# Altium project 机器人大赛硬件.PrjPcb (part 2 of 3)
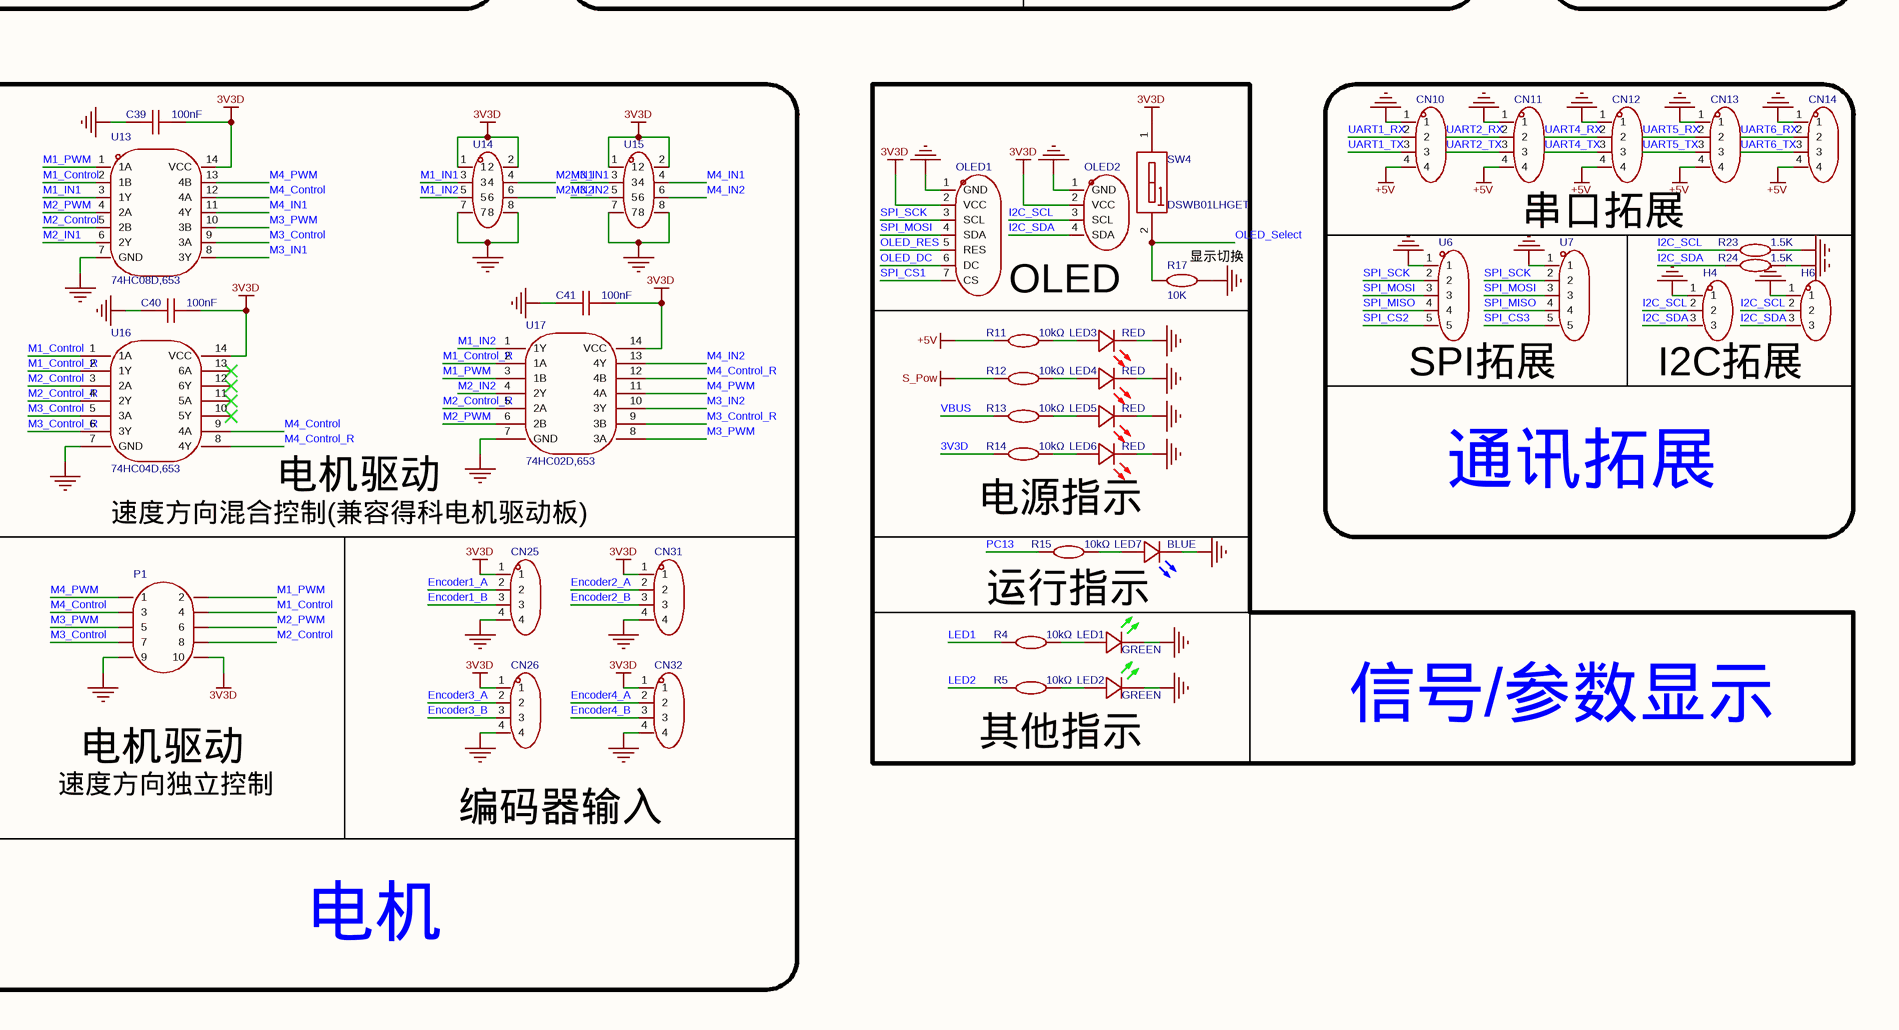
[diagram p4: P1.schdoc, bottom right]

## Sheet P1.schdoc (continued)
### Library data of the parts
C1-C21 C24-C28 C30 C31 C33-C38 = CAP_0603: Symbol: Capacitance; ConvertToPcb: yes; ModelId: ac125912035d415993ca9572d50418b1聨0819f05c4eef4c71ace90d822a990e87; ModelName: C0603_L1.6-W0.8-H0.8; ModelTransform: 62.992,31.496,0,0,0,0,0,0,0; Device: CAP_0603; AddInBom: yes; Supplier Footprint: 0603; FootprintName: C0603
  C1 C2: Value: 20pF
  C3 C4: Value: 2.2uF
  C5 C6: Value: 12.5pF
  C7 C20 C24 C35 C36: Value: 10uF
  C8-C19 C25 C28 C33 C34 C38: Value: 100nF
  C21: Value: 1uF
  C26 C27 C37: Value: 22uF
  C30: Value: 100pF
  C31: Value: 4.7nF
C22 = MA10V470M6X8: 容值:470uF;精度:±20%;额定电压:10V;纹波电流:3.1A@100kHz;等效串联电阻(ESR):20mΩ@100kHz;类型:聚合物;; Manufacturer: JIERR(捷而瑞); AddInBom: yes; ModelId: ccbda52dceed4b139172c40f75c9da3f聨0819f05c4eef4c71ace90d822a990e87; ModelTransform: 287.401,259.842,0,0,0,0,0,0,0; Tolerance: ±20%; Voltage Rating: 10V; Type: 聚合物; Lifetime: 2000hrs@105℃; Symbol: MA10V470M6X8; Device: MA10V470M6X8; LCSC Part Name: 470uF ±20% 10V; SupplierPart: C46550459; ManufacturerPart: MA10V470M6X8; Supplier Footprint: SMD,D6.3xL7.7mm; JLCPCB Part Class: Extended Part; Datasheet: https://item.szlcsc.com/datasheet/MA10V470M6X8/48680153.html; Supplier: LCSC; ConvertToPcb: yes; FootprintName: CAP-SMD_BD6.3-L6.6-W6.6-LS7.3-FD-H7.7; ModelName: CAP-SMD_BD6.3-L6.6-W6.6-LS7.3-FD-H7.7; Value: 470uF; Ripple Current: 3.1A@100kHz; Equivalent Series Resistance(ESR): 20mΩ@100kHz; Diameter: 6.3mm; Height - Seated (Max): 7mm; Operating Temperature: -55℃~+105℃
C23 C39-C41 = CAP_0603: Symbol: Capacitance; 3D Model: ac125912035d415993ca9572d50418b1聨0819f05c4eef4c71ace90d822a990e87; 3D Model Transform: 62.992,31.496,0,0,0,0,0,0,0; ConvertToPcb: yes; ModelName: C0603_L1.6-W0.8-H0.8; Device: CAP_0603; Supplier Footprint: 0603; AddInBom: yes; FootprintName: C0603
  C23: Value: 22uF
  C39-C41: Value: 100nF
C29 C32 = CGA0805X5R476M100MT: 容值:47uF;精度:±20%;额定电压:10V;温度系数:X5R;; Manufacturer: HRE(芯声); AddInBom: yes; ModelId: 1ba041120af144c991958decab20d241聨0819f05c4eef4c71ace90d822a990e87; ModelName: C0805_L2.0-W1.3-H1.3; ModelTransform: 78.74,51.181,0,0,0,0,0,0.0005,0; Tolerance: ±20%; Voltage Rating: 10V; Temperature Coefficient: X5R; Symbol: CGA0805X5R476M100MT; Device: CGA0805X5R476M100MT; LCSC Part Name: 47uF ±20% 10V; SupplierPart: C6119904; ManufacturerPart: CGA0805X5R476M100MT; Supplier Footprint: 0805; JLCPCB Part Class: Extended Part; Datasheet: https://item.szlcsc.com/datasheet/CGA0805X5R476M100MT/7062610.html; Supplier: LCSC; ConvertToPcb: yes; FootprintName: C0805; Value: 47uF
CN1-CN8 = ZX-XH2.54-3PZZ: 插针结构:1x3P;间距:2.5mm;安装方式:直插;参考系列:XH;总PIN数:3P;排数:1;每排PIN数:3;行距:-;额定电流:3A;触头材质:黄铜;触头镀层:锡;工作温度:-25℃~+85℃;; Manufacturer: Megastar(兆星); AddInBom: yes; ModelId: 59fb7dae5f784ea68cfa01be7f96d370聨0819f05c4eef4c71ace90d822a990e87; ModelTransform: 393.7,224.409,0,0,0,0,0,15.748,-137.795; Pins Structure: 1x3P; Pitch: 2.5mm; Reference Series: XH; Number of PINs Per Row: 3; Current Rating: 3A; Voltage Rating: 250V; Plastic Material: PA66; Flame Retardant Rating: UL94V-0; Z-Height of the Board: 7mm; X-Length of Bottom Edge on Board (Spacing Line): 10mm; Y-Width of Bottom Edge on Board: 5.9mm; Symbol: ZX-XH2.54-3PZZ; Device: ZX-XH2.54-3PZZ; LCSC Part Name: 1x3P 间距:2.5mm 直插 系列:XH; SupplierPart: C7429633; ManufacturerPart: ZX-XH2.54-3PZZ; Supplier Footprint: 插件,P=2.5mm; JLCPCB Part Class: Extended Part; Datasheet: https://item.szlcsc.com/datasheet/ZX-XH2.54-3PZZ/8427550.html; Supplier: LCSC; ConvertToPcb: yes; FootprintName: CONN-TH_3P-P2.54_2501S-3P; ModelName: CONN-TH_3P-P2.54_2501S-3P; Mounting Type: 直插; Number of Pins: 3P; Number of Rows: 1; Row Spacing: -; Contact Material: 黄铜; Contact Plating: 锡; Operating Temperature: -25℃~+85℃; Supplementary Features: -; Color: 白色
CN9 = XT60PW-M: 模型锂电连接器; Manufacturer: AMASS(艾迈斯); AddInBom: yes; ModelId: 37912d55e50045169535334d164bae93聨0819f05c4eef4c71ace90d822a990e87; ModelTransform: 712.597,610.235,0,0,0,0,-161.417,0,-118.11; Connector type: 卧式插头; interface form: 公头; Symbol: XT60PW-M; Device: XT60PW-M; LCSC Part Name: AMASS(艾迈斯)航模插头xt60连接器150公母对接pw锂电池公头 接PCB板卧式 黄色 公头XT60PW-M.G.Y; SupplierPart: C98732; ManufacturerPart: XT60PW-M; Supplier Footprint: -; JLCPCB Part Class: Extended Part; Datasheet: https://item.szlcsc.com/datasheet/XT60PW-M/99942.html; Supplier: LCSC; ConvertToPcb: yes; FootprintName: CONN-TH_XT60PW-M; ModelName: CONN-TH_XT60PW-M; colour: 黄色
CN10 = ZX-XH2.54-4PZZ: 插针结构:1x4P;间距:2.5mm;安装方式:直插;参考系列:XH;总PIN数:4P;排数:1;每排PIN数:4;行距:-;额定电流:3A;触头材质:黄铜;触头镀层:锡;工作温度:-25℃~+85℃;; Manufacturer: Megastar(兆星); AddInBom: yes; ModelId: 5458b55d28744a3c82c1e0e5bffe4e87聨0819f05c4eef4c71ace90d822a990e87; ModelTransform: 492.125,224.409,0,180,0,0,0,17.717,-118.11; Pins Structure: 1x4P; Pitch: 2.5mm; Reference Series: XH; Number of PINs Per Row: 4; Current Rating: 3A; Voltage Rating: 250V; Plastic Material: PA66; Flame Retardant Rating: UL94V-0; Z-Height of the Board: 7mm; X-Length of Bottom Edge on Board (Spacing Line): 12.5mm; Y-Width of Bottom Edge on Board: 5.9mm; Symbol: ZX-XH2.54-4PZZ; Device: ZX-XH2.54-4PZZ; LCSC Part Name: 1x4P 间距:2.5mm 直插 系列:XH; SupplierPart: C7429634; ManufacturerPart: ZX-XH2.54-4PZZ; Supplier Footprint: 插件,P=2.5mm; JLCPCB Part Class: Extended Part; Datasheet: https://item.szlcsc.com/datasheet/ZX-XH2.54-4PZZ/8427551.html; Supplier: LCSC; ConvertToPcb: yes; FootprintName: CONN-TH_4P-P2.50_4PIN; ModelName: CONN-TH_4P-P2.50_4PIN; Mounting Type: 直插; Number of Pins: 4P; Number of Rows: 1; Row Spacing: -; Contact Material: 黄铜; Contact Plating: 锡; Operating Temperature: -25℃~+85℃; Supplementary Features: -; Color: 白色
CN11-CN14 = ZX-XH2.54-4PZZ: 插针结构:1x4P;间距:2.5mm;安装方式:直插;参考系列:XH;总PIN数:4P;排数:1;每排PIN数:4;行距:-;额定电流:3A;触头材质:黄铜;触头镀层:锡;工作温度:-25℃~+85℃;; Manufacturer: Megastar(兆星); 3D Model: 5458b55d28744a3c82c1e0e5bffe4e87聨0819f05c4eef4c71ace90d822a990e87; 3D Model Transform: 492.125,224.409,0,180,0,0,0,17.717,-118.11; Pins Structure: 1x4P; Pitch: 2.5mm; Reference Series: XH; Number of PINs Per Row: 4; Current Rating: 3A; Voltage Rating: 250V; Plastic Material: PA66; Flame Retardant Rating: UL94V-0; Z-Height of the Board: 7mm; X-Length of Bottom Edge on Board (Spacing Line): 12.5mm; Y-Width of Bottom Edge on Board: 5.9mm; AddInBom: yes; Symbol: ZX-XH2.54-4PZZ; Device: ZX-XH2.54-4PZZ; LCSC Part Name: 1x4P 间距:2.5mm 直插 系列:XH; Supplier Part: C7429634; Manufacturer Part: ZX-XH2.54-4PZZ; Supplier Footprint: 插件,P=2.5mm; JLCPCB Part Class: Extended Part; Datasheet: https://item.szlcsc.com/datasheet/ZX-XH2.54-4PZZ/8427551.html; Supplier: LCSC; Mounting Type: 直插; Number of Pins: 4P; Number of Rows: 1; Row Spacing: -; Contact Material: 黄铜; Contact Plating: 锡; Operating Temperature: -25℃~+85℃; Supplementary Features: -; Color: 白色; ConvertToPcb: yes; FootprintName: CONN-TH_4P-P2.50_4PIN; ModelName: CONN-TH_4P-P2.50_4PIN
CN15-CN22 = HX-XH2.54-3PZZ: 插针结构:1x3P;间距:2.54mm;安装方式:直插;参考系列:XH;总PIN数:3P;排数:1;每排PIN数:3;行距:-;额定电流:3A;触头材质:黄铜;触头镀层:锡;工作温度:-25℃~+85℃;; Manufacturer: hanxia(韩下); AddInBom: yes; ModelId: 7caf8641f1664f899c46ebd0270126f6聨0819f05c4eef4c71ace90d822a990e87; ModelTransform: 393.7,232.6767,0,0,0,0,0,21.654,-133.858; Pins Structure: 1x3P; Pitch: 2.54mm; Reference Series: XH; Number of PINs Per Row: 3; Current Rating: 3A; Voltage Rating: 250V; Plastic Material: PA66; Flame Retardant Rating: UL94V-0; Symbol: HX-XH2.54-3PZZ; Device: HX-XH2.54-3PZZ; LCSC Part Name: 1x3P 间距:2.54mm 直插 系列:XH; SupplierPart: C42391661; ManufacturerPart: HX-XH2.54-3PZZ; Supplier Footprint: 插件,P=2.5mm; JLCPCB Part Class: Extended Part; Datasheet: https://item.szlcsc.com/datasheet/HX-XH2.54-3PZZ/44326933.html; Supplier: LCSC; ConvertToPcb: yes; FootprintName: CONN-TH_3P-P2.50_HC-XH-3A-G; ModelName: CONN-TH_3P-P2.50_HC-XH-3A-G; Mounting Type: 直插; Number of Pins: 3P; Number of Rows: 1; Row Spacing: -; Contact Material: 黄铜; Contact Plating: 锡; Operating Temperature: -25℃~+85℃; Color: 白色
CN23 CN24 CN27-CN30 CN33 CN34 = HX-XH2.54-3PZZ: 插针结构:1x3P;间距:2.54mm;安装方式:直插;参考系列:XH;总PIN数:3P;排数:1;每排PIN数:3;行距:-;额定电流:3A;触头材质:黄铜;触头镀层:锡;工作温度:-25℃~+85℃;; Manufacturer: hanxia(韩下); 3D Model: 7caf8641f1664f899c46ebd0270126f6聨0819f05c4eef4c71ace90d822a990e87; 3D Model Transform: 393.7,232.6767,0,0,0,0,0,21.654,-133.858; Pins Structure: 1x3P; Pitch: 2.54mm; Reference Series: XH; Number of PINs Per Row: 3; Current Rating: 3A; Voltage Rating: 250V; Plastic Material: PA66; Flame Retardant Rating: UL94V-0; AddInBom: yes; Symbol: HX-XH2.54-3PZZ; Device: HX-XH2.54-3PZZ; LCSC Part Name: 1x3P 间距:2.54mm 直插 系列:XH; Supplier Part: C42391661; Manufacturer Part: HX-XH2.54-3PZZ; Supplier Footprint: 插件,P=2.5mm; JLCPCB Part Class: Extended Part; Datasheet: https://item.szlcsc.com/datasheet/HX-XH2.54-3PZZ/44326933.html; Supplier: LCSC; Mounting Type: 直插; Number of Pins: 3P; Number of Rows: 1; Row Spacing: -; Contact Material: 黄铜; Contact Plating: 锡; Operating Temperature: -25℃~+85℃; Color: 白色; ConvertToPcb: yes; FootprintName: CONN-TH_3P-P2.50_HC-XH-3A-G; ModelName: CONN-TH_3P-P2.50_HC-XH-3A-G
CN25 CN26 CN31 CN32 = HX-XH2.54-4PZZ: 插针结构:1x4P;间距:2.54mm;安装方式:直插;参考系列:XH;总PIN数:4P;排数:1;每排PIN数:4;行距:-;额定电流:3A;触头材质:黄铜;触头镀层:锡;工作温度:-25℃~+85℃;; Manufacturer: hanxia(韩下); AddInBom: yes; ModelId: c69236e4c0a047c6aeeeefc1552045f5聨0819f05c4eef4c71ace90d822a990e87; ModelTransform: 492.125,228.346,0,180,0,0,0,-19.685,-137.795; Pins Structure: 1x4P; Pitch: 2.54mm; Reference Series: XH; Number of PINs Per Row: 4; Current Rating: 3A; Voltage Rating: 250V; Plastic Material: PA66; Flame Retardant Rating: UL94V-0; Symbol: HX-XH2.54-4PZZ; Device: HX-XH2.54-4PZZ; LCSC Part Name: 1x4P 间距:2.54mm 直插 系列:XH; SupplierPart: C42391662; ManufacturerPart: HX-XH2.54-4PZZ; Supplier Footprint: 插件,P=2.5mm; JLCPCB Part Class: Extended Part; Datasheet: https://item.szlcsc.com/datasheet/HX-XH2.54-4PZZ/44326934.html; Supplier: LCSC; ConvertToPcb: yes; FootprintName: CONN-TH_4P-P2.50-XH2.54-4P; ModelName: CONN-TH_4P-P2.50-XH2.54-4P; Mounting Type: 直插; Number of Pins: 4P; Number of Rows: 1; Row Spacing: -; Contact Material: 黄铜; Contact Plating: 锡; Operating Temperature: -25℃~+85℃; Color: 白色
D1 D2 = SMBJ6.5CA_C7420377: 极性:双向;反向截止电压(Vrwm):6.5V;钳位电压:11.2V;峰值脉冲电流(Ipp):53.57A;峰值脉冲功率(Ppp):600W;击穿电压:7.22V;; Manufacturer: R+O(宏嘉诚); AddInBom: yes; ModelId: feee8e3be32446ff9c045f3dafa6b9cb聨0819f05c4eef4c71ace90d822a990e87; ModelTransform: 208.661,139.764,0,0,0,0,0,0,0; Polarity: 双向; Reverse Stand-Off Voltage (Vrwm): 6.5V; Clamping Voltage: 11.2V; Peak Pulse Current (Ipp): 53.57A; Peak Pulse Power Dissipation (Ppp): 600W; Voltage - Breakdown: 7.22V; Reverse Leakage Current (Ir): 500uA; Number of Channels: 单路; level of protection: IEC 61000-4-2; Type: TVS; Symbol: SMBJ6.5CA_C7420377; Device: SMBJ6.5CA_C7420377; LCSC Part Name: 双向TVS 6.5V截止 峰值浪涌电流：53.57A; SupplierPart: C7420377; ManufacturerPart: SMBJ6.5CA; Supplier Footprint: DO-214AA(SMB); JLCPCB Part Class: Basic Part; Datasheet: https://item.szlcsc.com/datasheet/SMBJ6.5CA/8397199.html; Supplier: LCSC; ConvertToPcb: yes; FootprintName: SMB_L4.6-W3.5-LS5.3-BI; ModelName: SMB_L4.6-W3.5-LS5.3-BI; Operating Temperature: -55℃~+150℃
D3 = SMBJ5339B: 二极管配置:独立式;稳压值(标称值):5.6V;稳压值(范围):5.32V~5.88V;耗散功率(Pd):5W;; Manufacturer: R+O(宏嘉诚); AddInBom: yes; ModelId: 4a07d3f25b7245848b9fc4bc88d0221f聨0819f05c4eef4c71ace90d822a990e87; ModelTransform: 212.598,142.5194,0,0,0,0,0,0,0; Diode Configuration: 独立式; Zener Voltage(Nom): 5.6V; Reverse Leakage Current (Ir): 1uA; Pd - Power Dissipation: 5W; Impedance(Zzt): 1Ω; Impedance(Zzk): 400Ω; Operating Junction Temperature Range: -55℃~+150℃; Tolerance: ±5%; Symbol: SMBJ5339B; Device: SMBJ5339B; LCSC Part Name: 独立式 耐压:5.6V 电流:1uA; SupplierPart: C19077494; ManufacturerPart: SMBJ5339B; Supplier Footprint: DO-214AA(SMB); JLCPCB Part Class: Extended Part; Datasheet: https://item.szlcsc.com/datasheet/SMBJ5339B/20275579.html; Supplier: LCSC; ConvertToPcb: yes; FootprintName: SMB_L4.6-W3.6-LS5.4-RD; ModelName: SMB_L4.6-W3.6-LS5.4-RD; Zener Voltage(Range): 5.32V~5.88V
D5 = SS54_C7420369: 二极管配置:独立式;正向压降(Vf):550mV@5A;直流反向耐压(Vr):40V;整流电流:5A;; Manufacturer: R+O(宏嘉诚); AddInBom: yes; ModelId: 7e24bebe6cd74171ae8c9de6fc5b78aa聨0819f05c4eef4c71ace90d822a990e87; ModelTransform: 198.4248,103.5431,0,180,0,0,-0.001,0,0; Diode Configuration: 独立式; Voltage - DC Reverse(Vr): 40V; Current - Rectified: 5A; Reverse Leakage Current (Ir): 50uA@40V; Operating Junction Temperature Range: -55℃~+125℃; Non-Repetitive Peak Forward Surge Current: 120A; Symbol: SS54_C7420369; Device: SS54_C7420369; LCSC Part Name: 电压:40V 电流:5A; SupplierPart: C7420369; ManufacturerPart: SS54; Supplier Footprint: SMA(DO-214AC); JLCPCB Part Class: Extended Part; Datasheet: https://item.szlcsc.com/datasheet/SS54/8397191.html; Supplier: LCSC; ConvertToPcb: yes; FootprintName: SMA_L4.3-W2.6-LS5.0-FD; ModelName: SMA_L4.3-W2.6-LS5.0-FD; Voltage - Forward(Vf@If): 550mV@5A
D6 = BZV55-C3V3,115-JSM: 二极管配置:1个独立式;稳压值(标称值):3.3V;稳压值(范围):3.1V~3.5V;耗散功率(Pd):500mW;; Manufacturer: JSMSEMI(杰盛微); AddInBom: yes; ModelId: 27d27552bafd41ceb1963a6ed4584087聨0819f05c4eef4c71ace90d822a990e87; ModelName: SOD-80_BD1.5-L3.5; ModelTransform: 129.99974,62.968,0,0,0,0,0,0,0; Diode Configuration: 1个独立式; Zener Voltage(Nom): 3.3V; Reverse Leakage Current (Ir): 2uA@1V; Pd - Power Dissipation: 500mW; Impedance(Zzt): 85Ω; Impedance(Zzk): 600Ω; Symbol: BZV55-C3V3,115-JSM; Device: BZV55-C3V3,115-JSM; LCSC Part Name: BZV55-C3V3,115-JSM; SupplierPart: C53114242; ManufacturerPart: BZV55-C3V3,115-JSM; Supplier Footprint: MiniMELF; JLCPCB Part Class: Extended Part; Datasheet: https://item.szlcsc.com/datasheet/BZV55-C3V3%252C115-JSM/56091231.html; Supplier: LCSC; ConvertToPcb: yes; FootprintName: SOD-80_L3.5-W1.5-RD; Zener Voltage(Range): 3.1V~3.5V
D7 = SMBJ5339B: 二极管配置:独立式;稳压值(标称值):5.6V;稳压值(范围):5.32V~5.88V;耗散功率(Pd):5W;; Manufacturer: R+O(宏嘉诚); 3D Model: 4a07d3f25b7245848b9fc4bc88d0221f聨0819f05c4eef4c71ace90d822a990e87; 3D Model Transform: 212.598,142.5194,0,0,0,0,0,0,0; Diode Configuration: 独立式; Zener Voltage(Nom): 5.6V; Reverse Leakage Current (Ir): 1uA; Pd - Power Dissipation: 5W; Impedance(Zzt): 1Ω; Impedance(Zzk): 400Ω; Operating Junction Temperature Range: -55℃~+150℃; Tolerance: ±5%; AddInBom: yes; Symbol: SMBJ5339B; Device: SMBJ5339B; LCSC Part Name: 独立式 耐压:5.6V 电流:1uA; Supplier Part: C19077494; Manufacturer Part: SMBJ5339B; Supplier Footprint: DO-214AA(SMB); JLCPCB Part Class: Extended Part; Datasheet: https://item.szlcsc.com/datasheet/SMBJ5339B/20275579.html; Supplier: LCSC; Zener Voltage(Range): 5.32V~5.88V; ConvertToPcb: yes; FootprintName: SMB_L4.6-W3.6-LS5.4-RD; ModelName: SMB_L4.6-W3.6-LS5.4-RD
F1 = 2920L1000SL21GRG: 耐压(Vmax):21V;最大电流(Imax):50A;保持电流(Ihold):10A;跳闸电流(Itrip):14A;; Manufacturer: LUTE(陆特); AddInBom: yes; ModelId: 722e9de1dafa41d5aad743c061c32c52聨0819f05c4eef4c71ace90d822a990e87; ModelTransform: 314.1726,214.1728,0,0,0,0,0,0,0; Voltage - Max: 21V; Current - Max: 50A; Hold Current: 10A; Trip Current: 14A; Power Dissipation: 1.5W; Resistance - Initial (Ri) (Min): 1mΩ; Resistance - Post Trip (R1) (Max): 5mΩ; Time to Trip(Max): 5s; Symbol: 2920L1000SL21GRG; Device: 2920L1000SL21GRG; LCSC Part Name: 21V 10.00A 2920低电阻自恢复; SupplierPart: C22446882; ManufacturerPart: 2920L1000SL21GRG; Supplier Footprint: 2920; JLCPCB Part Class: Extended Part; Datasheet: https://item.szlcsc.com/datasheet/2920L1000SL21GRG/24099693.html; Supplier: LCSC; ConvertToPcb: yes; FootprintName: FUSE-SMD_L8.0-W5.5; ModelName: FUSE-SMD_L8.0-W5.5; Operating Temperature: -40℃~+85℃; Length: 7.98mm; Width: 5.44mm; Height: 0.8mm; Pitch: -
F2 = SMD1206-100-30: 耐压(Vmax):30V;最大电流(Imax):40A;保持电流(Ihold):1A;跳闸电流(Itrip):1.8A;; Manufacturer: R+O(宏嘉诚); AddInBom: yes; ModelId: f1628daad26847a79b887277a2bc8541聨0819f05c4eef4c71ace90d822a990e87; ModelName: F1206_L3.2-W1.7-H0.6; ModelTransform: 125.984,66.929,0,0,0,0,0,0,0; Voltage - Max: 30V; Current - Max: 40A; Hold Current: 1A; Trip Current: 1.8A; Power Dissipation: 1W; Resistance - Initial (Ri) (Min): 50mΩ; Resistance - Post Trip (R1) (Max): 300mΩ; Time to Trip(Max): 300ms; Symbol: SMD1206-100-30; Device: SMD1206-100-30; LCSC Part Name: SMD1206-100-30; SupplierPart: C46641026; ManufacturerPart: SMD1206-100-30; Supplier Footprint: 1206; JLCPCB Part Class: Extended Part; Datasheet: https://item.szlcsc.com/datasheet/SMD1206-100-30/48798732.html; Supplier: LCSC; ConvertToPcb: yes; FootprintName: F1206; Operating Temperature: -40℃~+85℃; Length: 3.6mm; Width: 1.9mm; Height: 1.3mm
H1-H3 = PZ254V-12-8P: 插针结构:2x4P;间距:2.54mm;行距:2.54mm;圆针/方针:方针;安装方式:直插;排数:双排;总PIN位数:8P;额定电流:-;额定电压:-;配合针长度:6mm;塑高:2.5mm;端接针长度:3mm;触头材质:黄铜;触头镀层:-;工作温度:-40℃~+105℃;颜色:黑色;; Manufacturer: XFCN(兴飞); AddInBom: yes; ModelId: 9655140a9899454ea9d6a6732d55fb0e聨0819f05c4eef4c71ace90d822a990e87; ModelName: HDR-TH_8P-P2.54-M-LI-2X4P; ModelTransform: 399.999,200,0,0,0,0,0,0,-118.11; Pin Structure: 2x4P; Pitch: 2.54mm; Circluar Pins/Square Pins: 方针; Symbol: PZ254V-12-8P; Device: PZ254V-12-8P; LCSC Part Name: 2x4P 间距:2.54mm 方针 直插; SupplierPart: C492421; ManufacturerPart: PZ254V-12-8P; Supplier Footprint: 插件,P=2.54mm; JLCPCB Part Class: Extended Part; Datasheet: https://item.szlcsc.com/datasheet/PZ254V-12-8P/502977.html; Supplier: LCSC; ConvertToPcb: yes; FootprintName: HDR-TH_8P-P2.54-V-M-R2-C4-S2.54; Row Spacing: 2.54mm; Mounting Type: 直插; Number of Rows: 双排; Number of Pins: 8P; Current Rating: -; Voltage Rating (Max): -; Length of Mating Pin: 6mm; Insulation Height: 2.5mm; Length of End Connection Pin: 3mm; Contact Material: 黄铜; Contact Plating: -; Operating Temperature: -40℃~+105℃; Color: 黑色
H4 H6 = 12251103CNG0S115001: 插针结构:1x3P;间距:2.54mm;行距:-;圆针/方针:方针;安装方式:直插;排数:单排;总PIN位数:3P;额定电流:3A;额定电压:-;配合针长度:6mm;塑高:2.5mm;端接针长度:3mm;触头材质:黄铜;触头镀层:-;工作温度:-40℃~+105℃;颜色:黑色;; Manufacturer: JILN(锦凌); AddInBom: yes; ModelId: 94a8ffe137b6410295cb18cd3ffd99db聨0819f05c4eef4c71ace90d822a990e87; ModelName: HDR-M-2.54_1x3; ModelTransform: 299.9994,100,0,0,0,0,0,0,-118.11; Pin Structure: 1x3P; Pitch: 2.54mm; Circluar Pins/Square Pins: 方针; Current Rating: 3A; Symbol: 12251103CNG0S115001; Device: 12251103CNG0S115001; LCSC Part Name: 1x3P 间距:2.54mm 方针 直插; SupplierPart: C429954; ManufacturerPart: 12251103CNG0S115001; Supplier Footprint: 插件,P=2.54mm; JLCPCB Part Class: Extended Part; Datasheet: https://item.szlcsc.com/datasheet/12251103CNG0S115001/426406.html; Supplier: LCSC; ConvertToPcb: yes; FootprintName: HDR-TH_3P-P2.54-V-M-1; Row Spacing: -; Mounting Type: 直插; Number of Rows: 单排; Number of Pins: 3P; Voltage Rating (Max): -; Length of Mating Pin: 6mm; Insulation Height: 2.5mm; Length of End Connection Pin: 3mm; Contact Material: 黄铜; Contact Plating: -; Operating Temperature: -40℃~+105℃; Color: 黑色
H5 = PZ254-1-05-W-8.5: 插针结构:1x5P;间距:2.54mm;行距:-;圆针/方针:方针;安装类型:弯插;排数:单排;总PIN位数:5P;额定电流:3A;额定电压:-;配合针长度:6mm;塑高:2.5mm;端接针长度:-;触头材质:-;工作温度范围:-40℃~+105℃;焊接温度(最大值):260℃@10S;颜色:黑色;; Manufacturer: HCTL(华灿天禄); 3D Model: feaf7b33e14742c6b47ff3c7b6fe898b; 3D Model Transform: 499.999,409.448,0,0,0,0,0,-191.181,-118.11; Pin Structure: 1x5P; Pitch: 2.54mm; Circluar Pins/Square Pins: 方针; Current Rating (Max): 3A; AddInBom: yes; Symbol: PZ254-1-05-W-8.5; Device: PZ254-1-05-W-8.5; LCSC Part Name: 1x5P 间距:2.54mm 方针 弯插; Supplier Part: C2894947; Manufacturer Part: PZ254-1-05-W-8.5; Supplier Footprint: 弯插,P=2.54mm; JLCPCB Part Class: 扩展库; Datasheet: https://atta.szlcsc.com/upload/public/pdf/source/20230609/872AF364EDF8DB2CAF0930EAB94ECB6E.pdf; Supplier: LCSC; Row Spacing: -; Mounting Type: 弯插; Number of Rows: 单排; Number of Pins: 5P; Voltage Rating (Max): -; Length of Mating Pin: 6mm; Insulation Height: 2.5mm; Length of End Connection Pin: -; Contact Material: -; Operating Temperature Range: -40℃~+105℃; Soldering Temperature(Max): 260℃@10S; Color: 黑色; ConvertToPcb: yes; FootprintName: HDR-TH_5P-P2.54-H-M-W10.4-N; ModelName: HDR-TH_5P-P2.54-H-M-W10.4-N
L1 = SRG0420-4R7-M: 电感值:4.7uH;精度:±20%;额定电流:3A;饱和电流(Isat):3.5A;类型:一体成型电感;; Manufacturer: JIERR(捷而瑞); AddInBom: yes; ModelId: 3b00517e351145dc8b8e2e52a7e5ed2c聨0819f05c4eef4c71ace90d822a990e87; ModelName: IND-SMD_L4.6-W4.1-H1.5; ModelTransform: 181.102,161.417,0,0,0,0,0,0,0; Tolerance: ±20%; Current Rating: 3A; Current - Saturation(Isat): 3.5A; DC Resistance(DCR): 105mΩ; Type: 一体成型电感; Symbol: SRG0420-4R7-M; Device: SRG0420-4R7-M; LCSC Part Name: 4.7μH ±20% 3.5A; SupplierPart: C53462918; ManufacturerPart: SRG0420-4R7-M; Supplier Footprint: SMD,4.6x4.1mm; JLCPCB Part Class: Extended Part; Datasheet: https://item.szlcsc.com/datasheet/SRG0420-4R7-M/56628163.html; Supplier: LCSC; ConvertToPcb: yes; FootprintName: IND-SMD_L4.6-W4.1-A; Value: 4.7uH
L2 = SRG0420-2R2-M: 电感值:2.2uH;精度:±20%;额定电流:4A;饱和电流(Isat):5A;类型:一体成型电感;; Manufacturer: JIERR(捷而瑞); AddInBom: yes; Tolerance: ±20%; Current Rating: 4A; Current - Saturation(Isat): 5A; DC Resistance(DCR): 49mΩ; Type: 一体成型电感; Symbol: SRG0420-2R2-M; Device: SRG0420-2R2-M; LCSC Part Name: 2.2μH ±20% 5A; SupplierPart: C53462916; ManufacturerPart: SRG0420-2R2-M; Supplier Footprint: SMD,4.6x4.1mm; JLCPCB Part Class: Extended Part; Datasheet: https://item.szlcsc.com/datasheet/SRG0420-2R2-M/56628161.html; Supplier: LCSC; ConvertToPcb: yes; FootprintName: IND-SMD_L4.6-W4.1_MHCI04015; Value: 2.2uH
L3 = SBH3216S221QSP: 阻抗@频率:220Ω@100MHz;误差:±25%;直流电阻(DCR):40mΩ;; Manufacturer: Sunltech(顺磁); AddInBom: yes; ModelId: 85bdab7b3d4c4074b81d208eb5e865b3聨0819f05c4eef4c71ace90d822a990e87; ModelName: L1206_L3.2-W1.6-H1.1; ModelTransform: 125.984,62.835,0,0,0,0,0,0,0; Tolerance: ±25%; DC Resistance(DCR): 40mΩ; Current Rating: 3A; Number of Circuits: 1; Symbol: SBH3216S221QSP; Device: SBH3216S221QSP; LCSC Part Name: 单路 1206磁珠 阻抗220Ω@100MHz; SupplierPart: C908351; ManufacturerPart: SBH3216S221QSP; Supplier Footprint: 1206; JLCPCB Part Class: Extended Part; Datasheet: https://item.szlcsc.com/datasheet/SBH3216S221QSP/974877.html; Supplier: LCSC; ConvertToPcb: yes; FootprintName: L1206; Impedance @ Frequency: 220Ω@100MHz; Operating Temperature: -55℃~+125℃
LED1 LED2 = GL0805UG01: 灯头类型:2mmx1.25mm方形灯头;发光颜色:翠绿色;正向压降(Vf):3.1V;功率:-;正向电流:5mA;波长:510nm~531nm;二极管配置:独立二极管;透镜颜色:无色透明透镜;色温:-;发光强度:299mcd;发光角度:120°;载带方式:正贴;工作温度:-40℃~+85℃;; Manufacturer: Guiguang light(桂光光电); AddInBom: yes; Illumination Color: 翠绿色; Voltage - Forward(Vf): 3.1V; Forward Current: 5mA; Diode Configuration: 独立二极管; Lens Color: 无色透明透镜; Luminous Intensity: 299mcd; Viewing Angle: 120°; Symbol: GL0805UG01; Device: GL0805UG01; Manufacturer Part: GREEN; LCSC Part Name: 0805 翠绿 高亮; SupplierPart: C51933308; Supplier Footprint: 0805; JLCPCB Part Class: Extended Part; Datasheet: https://item.szlcsc.com/datasheet/GL0805UG01/54646004.html; Supplier: LCSC; ConvertToPcb: yes; FootprintName: LED0805-FD_GL0805UG01; Lamp Holder Type: 2mmx1.25mm方形灯头; Power(Watts): -; Wavelength - Dominant: 510nm~531nm; Peak Wavelength: -; Color Temperature: -; Mounting Style: 正贴; Operating Temperature: -40℃~+85℃
LED3 LED9 = GL0805UR01: 灯头类型:2mmx1.25mm方形灯头;发光颜色:红色;正向压降(Vf):2.1V;功率:-;正向电流:20mA;波长:618nm~624nm;二极管配置:独立二极管;透镜颜色:无色透明透镜;色温:-;发光强度:100mcd;发光角度:120°;载带方式:正贴;工作温度:-40℃~+85℃;; Manufacturer: Guiguang light(桂光光电); 3D Model: f010e90d36544999ab4e363fdba5b490聨0819f05c4eef4c71ace90d822a990e87; 3D Model Transform: 78.74,49.21644,0,0,0,0,0,0,0; Illumination Color: 红色; Voltage - Forward(Vf): 2.1V; Forward Current: 20mA; Diode Configuration: 独立二极管; Lens Color: 无色透明透镜; Luminous Intensity: 100mcd; Viewing Angle: 120°; AddInBom: yes; Symbol: GL0805UR01; Device: GL0805UR01; Manufacturer Part: RED; LCSC Part Name: 0805 红灯 高亮; Supplier Part: C51933307; Supplier Footprint: 0805; JLCPCB Part Class: Extended Part; Datasheet: https://item.szlcsc.com/datasheet/GL0805UR01/54646003.html; Supplier: LCSC; Lamp Holder Type: 2mmx1.25mm方形灯头; Power(Watts): -; Wavelength - Dominant: 618nm~624nm; Peak Wavelength: -; Color Temperature: -; Mounting Style: 正贴; Operating Temperature: -40℃~+85℃; ConvertToPcb: yes; FootprintName: LED0805-R-RD_RED; ModelName: LED0805-R-RD_RED
LED4-LED6 = GL0805UR01: 灯头类型:2mmx1.25mm方形灯头;发光颜色:红色;正向压降(Vf):2.1V;功率:-;正向电流:20mA;波长:618nm~624nm;二极管配置:独立二极管;透镜颜色:无色透明透镜;色温:-;发光强度:100mcd;发光角度:120°;载带方式:正贴;工作温度:-40℃~+85℃;; Manufacturer: Guiguang light(桂光光电); AddInBom: yes; ModelId: f010e90d36544999ab4e363fdba5b490聨0819f05c4eef4c71ace90d822a990e87; ModelTransform: 78.74,49.21644,0,0,0,0,0,0,0; Illumination Color: 红色; Voltage - Forward(Vf): 2.1V; Forward Current: 20mA; Diode Configuration: 独立二极管; Lens Color: 无色透明透镜; Luminous Intensity: 100mcd; Viewing Angle: 120°; Symbol: GL0805UR01; Device: GL0805UR01; Manufacturer Part: RED; LCSC Part Name: 0805 红灯 高亮; SupplierPart: C51933307; Supplier Footprint: 0805; JLCPCB Part Class: Extended Part; Datasheet: https://item.szlcsc.com/datasheet/GL0805UR01/54646003.html; Supplier: LCSC; ConvertToPcb: yes; FootprintName: LED0805-R-RD_RED; ModelName: LED0805-R-RD_RED; Lamp Holder Type: 2mmx1.25mm方形灯头; Power(Watts): -; Wavelength - Dominant: 618nm~624nm; Peak Wavelength: -; Color Temperature: -; Mounting Style: 正贴; Operating Temperature: -40℃~+85℃
LED7 = GL0805UB01: 灯头类型:2mmx1.25mm方形灯头;发光颜色:蓝色;正向压降(Vf):3.1V;功率:-;正向电流:20mA；5mA;波长:457nm~475nm;二极管配置:独立二极管;透镜颜色:无色透明透镜;色温:-;发光强度:80mcd;发光角度:120°;载带方式:正贴;工作温度:-40℃~+85℃;; Manufacturer: Guiguang light(桂光光电); AddInBom: yes; ModelId: 6ccd75a2b5134d6ab756ecf3c14a7290聨0819f05c4eef4c71ace90d822a990e87; ModelName: LED0805-RD; ModelTransform: 79.527,49.2125,0,0,0,0,0,0,0; Illumination Color: 蓝色; Voltage - Forward(Vf): 3.1V; Diode Configuration: 独立二极管; Lens Color: 无色透明透镜; Luminous Intensity: 80mcd; Viewing Angle: 120°; Symbol: GL0805UB01; Device: GL0805UB01; Manufacturer Part: BLUE; LCSC Part Name: 0805 蓝灯 高亮; SupplierPart: C51933309; Supplier Footprint: 0805; JLCPCB Part Class: Extended Part; Datasheet: https://item.szlcsc.com/datasheet/GL0805UB01/54646005.html; Supplier: LCSC; ConvertToPcb: yes; FootprintName: LED0805-RD_BLUE; Lamp Holder Type: 2mmx1.25mm方形灯头; Power(Watts): -; Forward Current: 20mA；5mA; Wavelength - Dominant: 457nm~475nm; Peak Wavelength: -; Color Temperature: -; Mounting Style: 正贴; Operating Temperature: -40℃~+85℃
LED8 = GL0805UG01: 灯头类型:2mmx1.25mm方形灯头;发光颜色:翠绿色;正向压降(Vf):3.1V;功率:-;正向电流:5mA;波长:510nm~531nm;二极管配置:独立二极管;透镜颜色:无色透明透镜;色温:-;发光强度:299mcd;发光角度:120°;载带方式:正贴;工作温度:-40℃~+85℃;; Manufacturer: Guiguang light(桂光光电); Illumination Color: 翠绿色; Voltage - Forward(Vf): 3.1V; Forward Current: 5mA; Diode Configuration: 独立二极管; Lens Color: 无色透明透镜; Luminous Intensity: 299mcd; Viewing Angle: 120°; AddInBom: yes; Symbol: GL0805UG01; Device: GL0805UG01; Manufacturer Part: GREEN; LCSC Part Name: 0805 翠绿 高亮; Supplier Part: C51933308; Supplier Footprint: 0805; JLCPCB Part Class: Extended Part; Datasheet: https://item.szlcsc.com/datasheet/GL0805UG01/54646004.html; Supplier: LCSC; Lamp Holder Type: 2mmx1.25mm方形灯头; Power(Watts): -; Wavelength - Dominant: 510nm~531nm; Peak Wavelength: -; Color Temperature: -; Mounting Style: 正贴; Operating Temperature: -40℃~+85℃; ConvertToPcb: yes; FootprintName: LED0805-FD_GL0805UG01
OLED1 = HS96L01W4S03: 尺寸(inch):0.96;像素分辨率:128x64;; Manufacturer: HS(汉昇); AddInBom: yes; ModelId: 7927fe0e3c8842749d8ccfcaf6d2f492聨0819f05c4eef4c71ace90d822a990e87; ModelTransform: 1074.801,1094.486,0,0,0,0,0,-488.188,-157.48; Dot Pixels: 128x64; Type of Drive: 无源(PMOLED); Display Range: 21.74x10.86mm; Display Color: 白色; Luminance: 100cd/m2; Quiescent Current: 5uA; Symbol: HS96L01W4S03; Device: HS96L01W4S03; LCSC Part Name: 0.96寸 白光 128x64像素分辨率; SupplierPart: C5139758; ManufacturerPart: HS96L01W4S03; Supplier Footprint: -; JLCPCB Part Class: Extended Part; Datasheet: https://item.szlcsc.com/datasheet/HS96L01W4S03/5751920.html; Supplier: LCSC; ConvertToPcb: yes; FootprintName: OLED-TH_HS96L01W4S03; ModelName: OLED-TH_HS96L01W4S03; Size: 0.96; Operating Temperature: -40℃~+80℃
OLED2 = HS96L03W2C03: 核心芯片:SSD1315芯片;接口类型:I2C;尺寸(inch):0.96;像素分辨率:128x64;; Manufacturer: HS(汉昇); AddInBom: yes; ModelId: bb65183306db4ca69fb52250be49b00e聨0819f05c4eef4c71ace90d822a990e87; ModelTransform: 1070.864,1094.486,0,0,0,0,0,-498.424,0; Interface: I2C; Dot Pixels: 128x64; Type of Drive: 无源(PMOLED); Display Range: 21.744x10.864mm; Display Color: 白色; Luminance: 180cd/m2; Symbol: HS96L03W2C03; Device: HS96L03W2C03; LCSC Part Name: 0.96寸OLED显示屏窄白光IIC; SupplierPart: C5248080; ManufacturerPart: HS96L03W2C03; Supplier Footprint: -; JLCPCB Part Class: Extended Part; Datasheet: https://item.szlcsc.com/datasheet/HS96L03W2C03/5960631.html; Supplier: LCSC; ConvertToPcb: yes; FootprintName: OLED-TH_L27.8-W27.2-P2.54_C9900033791; ModelName: OLED-TH_L27.8-W27.2-P2.54_C9900033791; Controller Type: SSD1315芯片; Size: 0.96; Operating Temperature: -40℃~+70℃; Function: -; Quiescent Current: -
P1 = 2.54-2*5P简牛: 连接器类型:简牛座;间距:2.54mm;结构:2x5P;额定电流:1A;安装方式:直插;行距:2.54mm;排数:2;每排PIN数:5;触头材质:黄铜;触头镀层:金;工作温度:-55℃~+105℃;; Manufacturer: BOOMELE(博穆精密); Symbol: HDR-IDC-2.54-2X5P; AddInBom: yes; ModelId: 1d28e50a904749439e5167098e48e984聨0819f05c4eef4c71ace90d822a990e87; ModelTransform: 799.998,348.41478,0,0,0,0,0,3.937,-118.11; Connector Type: 简牛座; Pitch: 2.54mm; Number of Positions or Pins: 2x5P; Current Rating: 1A; Holder Type: 直插; Number of PINs Per Row: 5; Device: 2.54-2*5P简牛; LCSC Part Name: 2.54mm 2x5P 排数:2 每排P数:5; SupplierPart: C5665; ManufacturerPart: 2.54-2*5P简牛; Supplier Footprint: 插件,P=2.54mm; JLCPCB Part Class: Extended Part; Supplier: LCSC; ConvertToPcb: yes; FootprintName: IDC-TH_10P-P2.54_C5665; ModelName: HDR-IDC-2.54-2X5P; Row Spacing: 2.54mm; Number of Rows: 2; Contact Material: 黄铜; Contact Plating: 金; Operating Temperature: -55℃~+105℃; Color: 黑色
Q1 Q2 = HB03P250S: 数量:1个P沟道;漏源电压(Vdss):30V;连续漏极电流(Id):40A;导通电阻(RDS(on)):15mΩ@10V;耗散功率(Pd):50W;阈值电压(Vgs(th)):1.5V@250uA;; Manufacturer: R+O(宏嘉诚); 3D Model: 2bfbfbb77002446c96d8a76a432e0188聨0819f05c4eef4c71ace90d822a990e87; 3D Model Transform: 246.80147,383.8575,0,90,0,0,-31.302,0.003,0; Number: 1个P沟道; Drain to Source Voltage: 30V; Current - Continuous Drain(Id): 40A; Pd - Power Dissipation: 50W; Gate Charge(Qg): 43.8nC@10V; Input Capacitance(Ciss): 1.92nF; Reverse Transfer Capacitance (Crss@Vds): 196pF; Type: P沟道; Output Capacitance(Coss): 210pF; AddInBom: yes; Symbol: HB03P250S; Device: HB03P250S; LCSC Part Name: P沟道MOSFET; Supplier Part: C49256762; Manufacturer Part: HB03P250S; Supplier Footprint: TO-252; JLCPCB Part Class: Extended Part; Datasheet: https://item.szlcsc.com/datasheet/HB03P250S/51692162.html; Supplier: LCSC; RDS(on): 15mΩ@10V; Gate Threshold Voltage (Vgs(th)): 1.5V@250uA; Operating Temperature: -55℃~+150℃; ConvertToPcb: yes; FootprintName: TO-252-2_L6.6-W6.1-P4.60-LS10.0-BR-CW; ModelName: TO-252-2_L6.6-W6.1-P4.60-LS10.0-BR-CW
Q3 = HB03P250S: 数量:1个P沟道;漏源电压(Vdss):30V;连续漏极电流(Id):40A;导通电阻(RDS(on)):15mΩ@10V;耗散功率(Pd):50W;阈值电压(Vgs(th)):1.5V@250uA;; Manufacturer: R+O(宏嘉诚); AddInBom: yes; ModelId: 2bfbfbb77002446c96d8a76a432e0188聨0819f05c4eef4c71ace90d822a990e87; ModelTransform: 246.80147,383.8575,0,90,0,0,-31.302,0.003,0; Number: 1个P沟道; Drain to Source Voltage: 30V; Current - Continuous Drain(Id): 40A; Pd - Power Dissipation: 50W; Gate Charge(Qg): 43.8nC@10V; Input Capacitance(Ciss): 1.92nF; Reverse Transfer Capacitance (Crss@Vds): 196pF; Type: P沟道; Output Capacitance(Coss): 210pF; Symbol: HB03P250S; Device: HB03P250S; LCSC Part Name: P沟道MOSFET; SupplierPart: C49256762; ManufacturerPart: HB03P250S; Supplier Footprint: TO-252; JLCPCB Part Class: Extended Part; Datasheet: https://item.szlcsc.com/datasheet/HB03P250S/51692162.html; Supplier: LCSC; ConvertToPcb: yes; FootprintName: TO-252-2_L6.6-W6.1-P4.60-LS10.0-BR-CW; ModelName: TO-252-2_L6.6-W6.1-P4.60-LS10.0-BR-CW; RDS(on): 15mΩ@10V; Gate Threshold Voltage (Vgs(th)): 1.5V@250uA; Operating Temperature: -55℃~+150℃
Q4 = HL3401: 数量:-;漏源电压(Vdss):30V;连续漏极电流(Id):4.4A;导通电阻(RDS(on)):45.5mΩ@10V;耗散功率(Pd):1.2W;阈值电压(Vgs(th)):900mV@250uA;; Manufacturer: R+O(宏嘉诚); AddInBom: yes; ModelId: 89cb27a44ab2466697082bb9fd73a7d0聨0819f05c4eef4c71ace90d822a990e87; ModelName: SOT-23-3L_L2.9-W1.6-H1.1-LS2.8-P0.95; ModelTransform: 114.173,110.236,0,90,0,0,0,0,0; Drain to Source Voltage: 30V; Current - Continuous Drain(Id): 4.4A; Pd - Power Dissipation: 1.2W; Gate Charge(Qg): 22nC@4.5V; Input Capacitance(Ciss): 1.04nF@15V; Reverse Transfer Capacitance (Crss@Vds): 68pF@15V; Type: P沟道; Symbol: HL3401; Device: HL3401; LCSC Part Name: P沟道,电流:-4.4A,耐压:-30V; SupplierPart: C22469449; ManufacturerPart: HL3401; Supplier Footprint: SOT-23; JLCPCB Part Class: Extended Part; Datasheet: https://item.szlcsc.com/datasheet/HL3401/24180420.html; Supplier: LCSC; ConvertToPcb: yes; FootprintName: SOT-23-3_L3.0-W1.7-P0.95-LS2.9-BR; Number: -; RDS(on): 45.5mΩ@10V; Gate Threshold Voltage (Vgs(th)): 900mV@250uA; Operating Temperature: -55℃~+150℃
Q5 = SS8050_C7420370: 晶体管类型:NPN;集电极电流(Ic):1.5A;集射极击穿电压(Vceo):25V;耗散功率(Pd):300mW;直流电流增益(hFE):120@100mA,1.0V;; Manufacturer: R+O(宏嘉诚); AddInBom: yes; ModelId: c62791f0466c4ae2a892c056b845b0ca聨0819f05c4eef4c71ace90d822a990e87; ModelName: SOT-23-3P_L2.9-W1.3-H1.0-LS2.4-P0.95; ModelTransform: 98.425,114.173,0,180,0,0,0.0005,-0.0005,0; type: NPN; Current - Collector(Ic): 1.5A; Collector - Emitter Voltage VCEO: 25V; Pd - Power Dissipation: 300mW; Transition frequency(fT): 100MHz; Current - Collector Cutoff: 100nA; Vce Saturation(VCE(sat)): 500mV; Emitter-Base Voltage(Vebo): 5V; Symbol: SS8050_C7420370; Device: SS8050_C7420370; LCSC Part Name: H档 200-350 NPN 电流:1.5A 电压:25V; SupplierPart: C7420370; ManufacturerPart: SS8050; Supplier Footprint: SOT-23; JLCPCB Part Class: Extended Part; Datasheet: https://item.szlcsc.com/datasheet/SS8050/8397192.html; Supplier: LCSC; ConvertToPcb: yes; FootprintName: SOT-23-3_L2.9-W1.3-P1.90-LS2.4-BR; DC Current Gain: 120@100mA,1.0V; Operating Temperature: -55℃~+150℃
Q6 = HL3401: 数量:-;漏源电压(Vdss):30V;连续漏极电流(Id):4.4A;导通电阻(RDS(on)):45.5mΩ@10V;耗散功率(Pd):1.2W;阈值电压(Vgs(th)):900mV@250uA;; Manufacturer: R+O(宏嘉诚); 3D Model: 89cb27a44ab2466697082bb9fd73a7d0聨0819f05c4eef4c71ace90d822a990e87; 3D Model Transform: 114.173,110.236,0,90,0,0,0,0,0; Drain to Source Voltage: 30V; Current - Continuous Drain(Id): 4.4A; Pd - Power Dissipation: 1.2W; Gate Charge(Qg): 22nC@4.5V; Input Capacitance(Ciss): 1.04nF@15V; Reverse Transfer Capacitance (Crss@Vds): 68pF@15V; Type: P沟道; AddInBom: yes; ModelName: SOT-23-3L_L2.9-W1.6-H1.1-LS2.8-P0.95; Symbol: HL3401; Device: HL3401; LCSC Part Name: P沟道,电流:-4.4A,耐压:-30V; Supplier Part: C22469449; Manufacturer Part: HL3401; Supplier Footprint: SOT-23; JLCPCB Part Class: Extended Part; Datasheet: https://item.szlcsc.com/datasheet/HL3401/24180420.html; Supplier: LCSC; Number: -; RDS(on): 45.5mΩ@10V; Gate Threshold Voltage (Vgs(th)): 900mV@250uA; Operating Temperature: -55℃~+150℃; ConvertToPcb: yes; FootprintName: SOT-23-3_L3.0-W1.7-P0.95-LS2.9-BR
R1-R3 R6-R10 R17-R22 R28 R29 = Res_0603: Symbol: 电阻; ConvertToPcb: yes; ModelId: fc143cca1e79419f9cd78b61e9279f08聨0819f05c4eef4c71ace90d822a990e87; ModelTransform: 31.8897,63.7794,0,90,0,0,0,0,0; Device: Res_0603; AddInBom: yes; Supplier Footprint: 0603; FootprintName: R0603; ModelName: R0603
  R1-R3 R6-R10 R17-R21: Value: 10K
  R22: Value: 243K_1%
  R28 R29: Value: 5.1K
R4 R5 R11 R30-R32 = 0603WAF3162T5E: 电阻类型:厚膜电阻;阻值:31.6kΩ;精度:±1%;功率:100mW;工作电压:75V;温度系数:±100ppm/℃;; Manufacturer: UNI-ROYAL(厚声); 3D Model: fc143cca1e79419f9cd78b61e9279f08聨0819f05c4eef4c71ace90d822a990e87; 3D Model Transform: 31.8897,63.7794,0,90,0,0,0,0,0; Tolerance: ±1%; Power(Watts): 100mW; Voltage-Supply(Max): 75V; AddInBom: yes; Symbol: 0603WAF3162T5E; Device: 0603WAF3162T5E; LCSC Part Name: 31.6kΩ ±1% 100mW 厚膜电阻; Manufacturer Part: 0603WAF3162T5E; Supplier Footprint: 0603; JLCPCB Part Class: Extended Part; Datasheet: https://item.szlcsc.com/datasheet/0603WAF3162T5E/26710.html; Supplier: LCSC; Type: 厚膜电阻; Temperature Coefficient: ±100ppm/℃; Operating Temperature: -55℃~+155℃; ConvertToPcb: yes; FootprintName: R0603; ModelName: R0603
  R4 R5 R11 R30 R32: Value: 10kΩ
  R31: Value: 1kΩ
R12-R15 R25-R27 = 0603WAF3162T5E: 电阻类型:厚膜电阻;阻值:31.6kΩ;精度:±1%;功率:100mW;工作电压:75V;温度系数:±100ppm/℃;; Manufacturer: UNI-ROYAL(厚声); AddInBom: yes; ModelId: fc143cca1e79419f9cd78b61e9279f08聨0819f05c4eef4c71ace90d822a990e87; ModelTransform: 31.8897,63.7794,0,90,0,0,0,0,0; Tolerance: ±1%; Power(Watts): 100mW; Voltage-Supply(Max): 75V; Symbol: 0603WAF3162T5E; Device: 0603WAF3162T5E; LCSC Part Name: 31.6kΩ ±1% 100mW 厚膜电阻; ManufacturerPart: 0603WAF3162T5E; Supplier Footprint: 0603; JLCPCB Part Class: Extended Part; Datasheet: https://item.szlcsc.com/datasheet/0603WAF3162T5E/26710.html; Supplier: LCSC; ConvertToPcb: yes; FootprintName: R0603; ModelName: R0603; Type: 厚膜电阻; Temperature Coefficient: ±100ppm/℃; Operating Temperature: -55℃~+155℃
  R12-R15: Value: 10kΩ
  R25 R27: Value: 10kΩ_1%
  R26: Value: 31.6kΩ_1%
R16 R33 = 0603WAF1001T5E: 电阻类型:厚膜电阻;阻值:1kΩ;精度:±1%;功率:100mW;工作电压:75V;温度系数:±100ppm/℃;; Manufacturer: UNI-ROYAL(厚声); Symbol: 电阻; 3D Model: fc143cca1e79419f9cd78b61e9279f08; 3D Model Transform: 31.8897,63.7794,0,90,0,0,0,0,0; Tolerance: ±1%; Power(Watts): 100mW; Voltage-Supply(Max): 75V; AddInBom: yes; Device: 0603WAF1001T5E; LCSC Part Name: 1kΩ ±1% 100mW 厚膜电阻; Supplier Part: C21190; Manufacturer Part: 0603WAF1001T5E; Supplier Footprint: 0603; JLCPCB Part Class: Basic Part; Datasheet: https://item.szlcsc.com/datasheet/0603WAF1001T5E/21904.html; Supplier: LCSC; Type: 厚膜电阻; Value: 1kΩ; Temperature Coefficient: ±100ppm/℃; Operating Temperature: -55℃~+155℃; ConvertToPcb: yes; FootprintName: R0603; ModelName: R0603
R23 R24 = Res_0603: Symbol: 电阻; 3D Model: fc143cca1e79419f9cd78b61e9279f08聨0819f05c4eef4c71ace90d822a990e87; 3D Model Transform: 31.8897,63.7794,0,90,0,0,0,0,0; ConvertToPcb: yes; Device: Res_0603; Supplier Footprint: 0603; Value: 1.5K; AddInBom: yes; FootprintName: R0603; ModelName: R0603
SW1 SW2 SW5-SW8 = TS-1101-C-W: 电路结构:单刀单掷;按钮形状:矩形按钮;作用力:2.6N;安装方式:立贴;开关长度:6mm;开关宽度:3.6mm;开关高度:2.5mm;带支架:不带支架;触点电流:50mA;额定电压:12V;带灯:无;工作寿命:5万次;; Manufacturer: XKB Connection(中国星坤); AddInBom: yes; ModelId: 0fd6340cfb7d45bfbbb5f8576d023f85聨0819f05c4eef4c71ace90d822a990e87; ModelTransform: 315.232,145.669,0,0,0,0,0,0,0; Circuit: 单刀单掷; Actuator Style: 矩形按钮; Operating Force: 2.6N; Switch Height: 2.5mm; with Bracket: 不带支架; Contact Current: 50mA; Voltage Rating: 12V; With Lamp: 无; Life: 5万次; Symbol: TS-1101-C-W; Device: TS-1101-C-W; LCSC Part Name: 6*3.6*2.5mm 立贴 轻触开关; SupplierPart: C318938; ManufacturerPart: TS-1101-C-W; Supplier Footprint: SMD,6x3.6mm; JLCPCB Part Class: Extended Part; Datasheet: https://item.szlcsc.com/datasheet/TS-1101-C-W/300030.html; Supplier: LCSC; ConvertToPcb: yes; FootprintName: SW-SMD_L6.0-W3.3-LS8.0_TS-1101-C-W; ModelName: SW-SMD_L6.0-W3.3-LS8.0_TS-1101-C-W; Mounting Type: 立贴; Length: 6mm; Width: 3.6mm; Actuator/Cap Color: -; IP Rating: -; Termination Style: -; Operating Temperature: -30℃~+85℃
SW3 = WS-1004-ARL10026: Manufacturer: XUNPU(讯普); AddInBom: yes; ModelId: 98ba71c673cb4da4aaef5b40973da147聨0819f05c4eef4c71ace90d822a990e87; ModelTransform: 442.9125,410.74477,0,0,0,0,0,0,-147.638; Contact Current: 100mA; Voltage Rating: 12V; Symbol: WS-1004-ARL10026; Device: WS-1004-ARL10026; LCSC Part Name: 12*12*10H插件6脚立式五向按键开关 多功能摇杆开关; SupplierPart: C42377836; ManufacturerPart: WS-1004-ARL10026; Supplier Footprint: 插件-6P,10.2x10.2mm; JLCPCB Part Class: Extended Part; Datasheet: https://item.szlcsc.com/datasheet/WS-1004-ARL10026/44278003.html; Supplier: LCSC; ConvertToPcb: yes; FootprintName: SW-TH_WS-1004-ARL10026; ModelName: SW-TH_WS-1004-ARL10026; Switch Type: -; Mounting Type: 直插; Operating Temperature: -25℃~+70℃
SW4 = DSWB01LHGET: 类型:平拨,凸起式;电路结构:单刀单掷;开关位数:1位;工作寿命:-;颜色:红色;; Manufacturer: YE; AddInBom: yes; ModelId: 0f47cc4368c24d779ddaf17d8f9a8b63聨0819f05c4eef4c71ace90d822a990e87; ModelName: SW-TH_2P-L4.1-W9.9-H5.4-P2.54; ModelTransform: 161.417,389.763,0,0,0,0,2.205,-1.024,-125.984; Circuit: 单刀单掷; Number of Positions: 1位; Symbol: DSWB01LHGET; Device: DSWB01LHGET; LCSC Part Name: 红色宽体1位顶拨插件; SupplierPart: C126888; ManufacturerPart: DSWB01LHGET; Supplier Footprint: 插件,9.9x4mm; JLCPCB Part Class: Extended Part; Datasheet: https://item.szlcsc.com/datasheet/DSWB01LHGET/138168.html; Supplier: LCSC; ConvertToPcb: yes; FootprintName: SW-TH_DSWB01LHGET; Type: 平拨,凸起式; Lead Pitch: -; Operating Life: -; Color: 红色
U1 = STM32F407ZGT6: CPU内核:ARM-M4;CPU最大主频:168MHz;应用领域:-;; Manufacturer: ST(意法半导体); Relevance: []; Add into BOM: yes; 3D Model: 4b55735481674d0c808bacd550892b80聨0819f05c4eef4c71ace90d822a990e87; 3D Model Transform: 866.14,866.14,0,0,0,0,0,0,0; CPU Core: ARM-M4; CPU Maximum Speed: 168MHz; Program Storage Size: 1MB; Program Memory Type: FLASH; Number of I/O: 114; ADC (Bit): 12bit; Voltage - Supply: 1.8V~3.6V; Symbol: STM32F407ZGT6; Device: STM32F407ZGT6; Convert to PCB: yes; LCSC Part Name: 带DSP和FPU的高性能基础系列ARM Cortex-M4 MCU，具有1 MB Flash、168 MHz CPU、ART加速器、以太网和FSMC; Supplier Part: C19156; Manufacturer Part: STM32F407ZGT6; Supplier Footprint: LQFP-144(20x20); JLCPCB Part Class: Extended Part; Datasheet: https://item.szlcsc.com/datasheet/STM32F407ZGT6/19860.html; Supplier: LCSC; DAC (Bit): 12bit; Applications: -; FootprintName: LQFP-144_L20.0-W20.0-P0.50-LS22.0-BL; ModelName: LQFP-144_L20.0-W20.0-P0.50-LS22.0-BL
U2 = AT24C64: 接口类型:I2C;存储容量:64Kbit;时钟频率(fc):1MHz;; Manufacturer: IDCHIP(英锐芯); AddInBom: yes; ModelId: 75c24a7891ee4dd6bdac16a7163ff87e聨0819f05c4eef4c71ace90d822a990e87; ModelName: SOP-8_L4.9-W3.9-P1.27-LS6.0-BL-1; ModelTransform: 192.913,236.22,0,0,0,0,-0.393,2.749,0; Interface: I2C; Memory Size: 64Kbit; Clock Frequency: 1MHz; Voltage - Supply: 1.8V~5.5V; Write Cycle Time(Tw): 5ms; Data Retention - TDR (Year): 100年; Write Cycle Endurance: 100万次; Symbol: AT24C64; Device: AT24C64; LCSC Part Name: 串行电可擦除编程只读存储器; SupplierPart: C18186739; ManufacturerPart: AT24C64; Supplier Footprint: SOP-8; JLCPCB Part Class: Extended Part; Datasheet: https://item.szlcsc.com/datasheet/AT24C64/19335673.html; Supplier: LCSC; ConvertToPcb: yes; FootprintName: SOP-8_L4.9-W3.9-P1.27-LS6.0-BL; Operating Temperature: -40℃~+85℃
U3 U4 = MT-0-102-A101-M200-RS: 电路结构:单刀双掷;工作寿命:-;额定电流:5A;额定电压(AC):125V;安装方式:直插;; Manufacturer: YUEN FUNG(源丰); Symbol: MT-0-102-A101-M200-RS+PJ; AddInBom: yes; ModelId: 00333f9652344e77a6fef9f3435a33d8聨0819f05c4eef4c71ace90d822a990e87; ModelTransform: 511.81,432.84,0,0,0,0,0,0,-118.11; Circuit: 单刀双掷; Switch Height: 28.6mm; Current Rating: 5A; Voltage Rating (AC): 125V; Actuator Type: 圆柱钮柄; Device: MT-0-102-A101-M200-RS; LCSC Part Name: 五件套 小型钮子三脚二档; SupplierPart: C1788492; ManufacturerPart: MT-0-102-A101-M200-RS; Supplier Footprint: 插件,13x8mm; JLCPCB Part Class: Extended Part; Datasheet: https://item.szlcsc.com/datasheet/MT-0-102-A101-M200-RS/1879283.html; Supplier: LCSC; ConvertToPcb: yes; FootprintName: SW-TH_MT-0-103-A101-M200-RS; ModelName: SW-TH_MT-0-103-A101-M200-RS; Length: 13mm; Width: 8mm; Life: -; Termination Style: 焊片; Mounting Type: 直插; Operating Temperature: -25℃~+85℃
U5 = 2.54-2*5: 插孔结构:2x5P;间距:2.54mm;行距:2.54mm;圆孔/方孔:方孔;安装方式:直插;排数:双排;总孔位数:10P;额定电流:2.5A;额定电压:-;插孔方向:顶部;塑高:8.5mm;工作温度:-40℃~+105℃;; Manufacturer: ZHOURI(洲日); AddInBom: yes; ModelId: 86e5d65f54dd476391caab3fdb916824聨0819f05c4eef4c71ace90d822a990e87; ModelName: HDR2.54-F-LI-2X5P; ModelTransform: 499.999,200,0,0,0,0,0,0,-118.11; Holes Structure: 2x5P; Pitch: 2.54mm; Circular Hole / Square Hole: 方孔; Number of Positions: 10P; Current Rating: 2.5A; Holes Direction: 顶部; Symbol: 2.54-2*5; Device: 2.54-2*5; LCSC Part Name: 间距:2.54mm 2x5P 直插; SupplierPart: C2977587; ManufacturerPart: 2.54-2*5; Supplier Footprint: 插件,P=2.54mm; JLCPCB Part Class: Extended Part; Datasheet: https://item.szlcsc.com/datasheet/2.54-2*5/3388939.html; Supplier: LCSC; ConvertToPcb: yes; FootprintName: HDR-TH_10P-P2.54-V-F-R2-C5-S2.54; Row Spacing: 2.54mm; Mounting Type: 直插; Number of Rows: 双排; Voltage Rating (Max): -; Insulation Height: 8.5mm; Operating Temperature: -40℃~+105℃
U6 U7 = MTP125-1105S1: 插针结构:1x5P;间距:2.54mm;行距:-;圆针/方针:方针;安装方式:直插;排数:单排;总PIN位数:5P;额定电流:3A;额定电压:-;配合针长度:6mm;塑高:2.5mm;端接针长度:3mm;触头材质:黄铜;触头镀层:-;工作温度:-40℃~+105℃;颜色:黑色;; Manufacturer: MINTRON(明硕); AddInBom: yes; ModelId: 47d466e4a34f4fc5bc626cf773a24dd5聨0819f05c4eef4c71ace90d822a990e87; ModelName: HDR-TH_5P-P2.54-M-LI-1X5P; ModelTransform: 499.999,100,0,0,0,0,0,0,-118.11; Pin Structure: 1x5P; Pitch: 2.54mm; Circluar Pins/Square Pins: 方针; Current Rating: 3A; Symbol: MTP125-1105S1; Device: MTP125-1105S1; LCSC Part Name: 1x5P 间距:2.54mm 方针 直插; SupplierPart: C358687; ManufacturerPart: MTP125-1105S1; Supplier Footprint: 插件,P=2.54mm; JLCPCB Part Class: Extended Part; Datasheet: https://item.szlcsc.com/datasheet/MTP125-1105S1/333687.html; Supplier: LCSC; ConvertToPcb: yes; FootprintName: HDR-TH_5P-P2.54-V-M; Row Spacing: -; Mounting Type: 直插; Number of Rows: 单排; Number of Pins: 5P; Voltage Rating (Max): -; Length of Mating Pin: 6mm; Insulation Height: 2.5mm; Length of End Connection Pin: 3mm; Contact Material: 黄铜; Contact Plating: -; Operating Temperature: -40℃~+105℃; Color: 黑色
U8 = XDFH-0254-2*9P: 连接器类型:简牛座;间距:2.54mm;结构:2x9P;额定电流:3A;额定电压:500V;安装方式:直插;排数:2;每排PIN数:9;触头材质:铜;触头镀层:金;工作温度:-45℃~+105℃;; Manufacturer: LX(连欣科技); AddInBom: yes; ModelId: dd455ba1218d4feca2fe6377a7bdaadf聨0819f05c4eef4c71ace90d822a990e87; ModelTransform: 1199.2102,350.7867,0,0,0,0,0,3.937,-125.984; Connector Type: 简牛座; Pitch: 2.54mm; Number of Positions or Pins: 2x9P; Current Rating: 3A; Voltage Rating (Max): 500V; Holder Type: 直插; Number of PINs Per Row: 9; Symbol: XDFH-0254-2*9P; Device: XDFH-0254-2*9P; LCSC Part Name: 镀2U全金品质简牛插座PH2.54MM-2*9PIN直插板 DIP; SupplierPart: C19193809; ManufacturerPart: XDFH-0254-2*9P; Supplier Footprint: 插件,P=2.54mm; JLCPCB Part Class: Extended Part; Datasheet: https://item.szlcsc.com/datasheet/XDFH-0254-2*9P/20445779.html; Supplier: LCSC; ConvertToPcb: yes; FootprintName: CONN-TH_18P-P2.54_LX_XDFH-0254-2X9P; ModelName: CONN-TH_18P-P2.54_LX_XDFH-0254-2X9P; Number of Rows: 2; Contact Material: 铜; Contact Plating: 金; Operating Temperature: -45℃~+105℃
U9 = TPS54560DDAR: 功能类型:降压型;工作电压:4.5V~60V;输出电压:800mV~58.8V;输出电流:5A;输出类型:可调;; Manufacturer: TI(德州仪器); AddInBom: yes; ModelId: d3dfb165ce8644e793b750cd6f375e75聨0819f05c4eef4c71ace90d822a990e87; ModelTransform: 192.913,236.22,0,0,0,0,0,0,0; Function: 降压型; Output Current: 5A; Frequency - Switching: 2.5MHz; Synchronous Rectifier: 否; Number of Outputs: 1; Topology: 降压式; Quiescent Current: 146uA; Switch tube (built-in/external): 内置; Output Type: 可调; Symbol: TPS54560DDAR; Device: TPS54560DDAR; LCSC Part Name: 降压型 5A 4.5V~60V; SupplierPart: C31966; ManufacturerPart: TPS54560DDAR; Supplier Footprint: SOIC-8-EP; JLCPCB Part Class: Extended Part; Datasheet: https://www.ti.com/cn/lit/gpn/tps54560; Supplier: LCSC; ConvertToPcb: yes; FootprintName: SOIC-8_L5.0-W4.0-P1.27-LS6.0-BL-EP2.0; ModelName: SOIC-8_L5.0-W4.0-P1.27-LS6.0-BL-EP2.0; Voltage - Supply: 4.5V~60V; Output Voltage: 800mV~58.8V; Operating Temperature: -40℃~+150℃@(TJ); Features: 轻载高效模式；外部补偿；频率同步；逐波限流；过流保护
U10 = CH340N: 应用功能:USB转串口;USB协议版本:USB 2.0;通道数:1;数据速率:2Mbps;; Manufacturer: WCH(南京沁恒); Symbol: CH340N_C2977777; AddInBom: yes; ModelId: 75c24a7891ee4dd6bdac16a7163ff87e聨0819f05c4eef4c71ace90d822a990e87; ModelName: SOP-8_L4.9-W3.9-P1.27-LS6.0-BL-1; ModelTransform: 192.913,236.22,0,0,0,0,-0.393,2.749,0; Applications Function: USB转串口; USB Protocol: USB 2.0; Number of Channels: 1; Voltage - Supply: 3.3V；5V; Data Rate: 2Mbps; Device: CH340N; LCSC Part Name: USB2.0芯片CH340; SupplierPart: C2977777; ManufacturerPart: CH340N; Supplier Footprint: SOP-8; JLCPCB Part Class: Extended Part; Datasheet: https://item.szlcsc.com/datasheet/CH340N/3390257.html; Supplier: LCSC; ConvertToPcb: yes; FootprintName: SOP-8_L4.9-W3.9-P1.27-LS6.0-BL; Operating Temperature: -20℃~+70℃; Features: 可编程波特率；内置时钟发生器；上电复位
U11 = PW05: Add into BOM: no; Convert to PCB: yes; Symbol: PW05; Device: PW05; Supplier Footprint: SMD; JLCPCB Part Class: 扩展库; FootprintName: BULETM-SMD_RF-BM-4044B2
U12 = B4B-XH-A(LF)(SN): 插针结构:1x4P;间距:2.5mm;安装方式:直插;参考系列:XH;总PIN数:4P;排数:1;每排PIN数:4;行距:-;额定电流:3A;触头材质:黄铜;触头镀层:锡;工作温度:-25℃~+85℃;; Manufacturer: JST; AddInBom: yes; ModelId: c446e4e7b33e4b93abd060089da81fad聨0819f05c4eef4c71ace90d822a990e87; ModelName: XH2.5-4A; ModelTransform: 492.125,224.44837,0,180,0,0,-0.001,17.716,-98.425; Pins Structure: 1x4P; Pitch: 2.5mm; Reference Series: XH; Number of PINs Per Row: 4; Current Rating: 3A; Voltage Rating: 250V; Plastic Material: PA66; Flame Retardant Rating: UL94V-0; Supplementary Features: 打K脚; Z-Height of the Board: 7mm; X-Length of Bottom Edge on Board (Spacing Line): 12.4mm; Y-Width of Bottom Edge on Board: 5.75mm; Symbol: B4B-XH-A(LF)(SN); Device: B4B-XH-A(LF)(SN); LCSC Part Name: 1x4P 间距:2.5mm 直插 系列:XH; SupplierPart: C144395; ManufacturerPart: B4B-XH-A(LF)(SN); Supplier Footprint: 插件,P=2.5mm; JLCPCB Part Class: Extended Part; Datasheet: https://item.szlcsc.com/datasheet/B4B-XH-A(LF)(SN)/155727.html; Supplier: LCSC; ConvertToPcb: yes; FootprintName: CONN-TH_B4B-XH-A-LF-SN; Mounting Type: 直插; Number of Pins: 4P; Number of Rows: 1; Row Spacing: -; Contact Material: 黄铜; Contact Plating: 锡; Operating Temperature: -25℃~+85℃; Color: 白色
U13 = 74HC08D,653: 逻辑类型:与门;通道数:4;工作电压:2V~6V;静态电流(Iq):2uA;传播延迟(tpd):27ns@4.5V,50pF;; Manufacturer: Nexperia(安世); AddInBom: yes; ModelId: 8dbf5b715d42428c85558507ae5a252b聨0819f05c4eef4c71ace90d822a990e87; ModelName: SOIC-14_L8.6-W3.9-H1.8-LS6.0-P1.27; ModelTransform: 338.583,236.22,0,0,0,0,0,0.001,0; Logic Type: 与门; Number of Channels: 4; Voltage - Supply: 2V~6V; Quiescent Current: 2uA; Current - Output Low(IOL): 5.2mA; Input Logic Level - High: 1.5V~4.2V; Input Logic Level - Low: 500mV~1.8V; Output Logic Level - High: 3.7V；1.9V；5.2V; Output Logic Level - Low: 100mV；400mV; Input Number: 2; Symbol: 74HC08D,653; Device: 74HC08D,653; LCSC Part Name: 四路二输入与门; SupplierPart: C5593; ManufacturerPart: 74HC08D,653; Supplier Footprint: SOIC-14; JLCPCB Part Class: Extended Part; Datasheet: https://item.szlcsc.com/datasheet/74HC08D%252C653/6044.html; Supplier: LCSC; ConvertToPcb: yes; FootprintName: SOIC-14_L8.7-W3.9-P1.27-LS6.0-BL; Current - Output High(IOH): 5.2mA; Series: 74HC系列; Propagation Delay: 27ns@4.5V,50pF; Operating Temperature: -40℃~+125℃